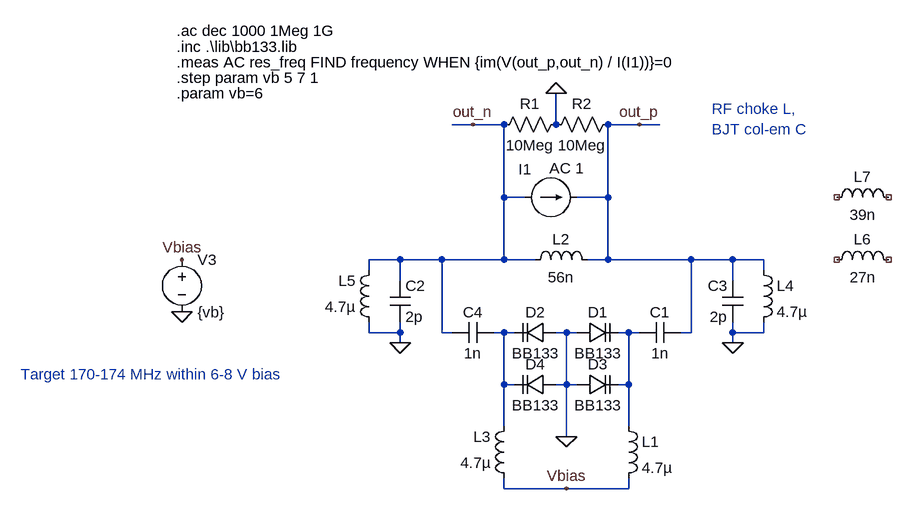
[diagram p0: schematic VHF_VCO_LO_tank.asc]
VHF_VCO_LO_tank.asc, the LTspice schematic file:
Version 4.1
SHEET 1 1056 1420
WIRE 224 736 192 736
WIRE 272 736 224 736
WIRE 352 736 352 688
WIRE 480 736 432 736
WIRE 512 736 480 736
WIRE 272 848 272 736
WIRE 304 848 272 848
WIRE 432 848 432 736
WIRE 432 848 384 848
WIRE 112 944 64 944
WIRE 176 944 112 944
WIRE 272 944 272 848
WIRE 272 944 176 944
WIRE 320 944 272 944
WIRE 432 944 432 848
WIRE 432 944 400 944
WIRE 560 944 432 944
WIRE 624 944 560 944
WIRE 672 944 624 944
WIRE 64 960 64 944
WIRE 672 960 672 944
WIRE 112 976 112 944
WIRE 624 976 624 944
WIRE 64 1056 64 1040
WIRE 112 1056 112 1040
WIRE 112 1056 64 1056
WIRE 176 1056 176 944
WIRE 192 1056 176 1056
WIRE 272 1056 256 1056
WIRE 288 1056 272 1056
WIRE 368 1056 352 1056
WIRE 384 1056 368 1056
WIRE 464 1056 448 1056
WIRE 480 1056 464 1056
WIRE 560 1056 560 944
WIRE 560 1056 544 1056
WIRE 624 1056 624 1040
WIRE 672 1056 672 1040
WIRE 672 1056 624 1056
WIRE 112 1072 112 1056
WIRE 624 1072 624 1056
WIRE 272 1136 272 1056
WIRE 288 1136 272 1136
WIRE 368 1136 368 1056
WIRE 368 1136 352 1136
WIRE 384 1136 368 1136
WIRE 464 1136 464 1056
WIRE 464 1136 448 1136
WIRE 272 1200 272 1136
WIRE 464 1200 464 1136
WIRE 368 1216 368 1136
WIRE 272 1296 272 1280
WIRE 368 1296 272 1296
WIRE 464 1296 464 1280
WIRE 464 1296 368 1296
FLAG -224 1024 0
FLAG -224 944 Vbias
FLAG 352 688 0
FLAG 480 736 out_p
FLAG 224 736 out_n
FLAG 368 1296 Vbias
FLAG 368 1216 0
FLAG 112 1072 0
FLAG 624 1072 0
SYMBOL varactor 384 1072 R270
WINDOW 0 32 32 VTop 2
WINDOW 3 0 32 VBottom 2
SYMATTR InstName D1
SYMATTR Value BB133
SYMATTR Prefix X
SYMBOL ind 304 960 R270
WINDOW 0 32 56 VTop 2
WINDOW 3 5 56 VBottom 2
SYMATTR InstName L2
SYMATTR Value 56n
SYMATTR SpiceLine Rser=3.9 Cpar=313f
SYMBOL varactor 352 1040 R90
WINDOW 0 0 32 VBottom 2
WINDOW 3 32 32 VTop 2
SYMATTR InstName D2
SYMATTR Value BB133
SYMATTR Prefix X
SYMBOL voltage -224 928 R0
WINDOW 123 0 0 Left 0
WINDOW 39 0 0 Left 0
WINDOW 3 24 97 Left 2
SYMATTR Value {vb}
SYMATTR InstName V3
SYMBOL current 304 848 R270
WINDOW 0 43 -10 VRight 2
WINDOW 3 24 0 Left 2
WINDOW 123 45 38 VRight 2
WINDOW 39 0 0 Left 0
SYMATTR InstName I1
SYMATTR Value ""
SYMATTR Value2 AC 1
SYMBOL res 368 720 R90
WINDOW 0 0 56 VBottom 2
WINDOW 3 32 56 VTop 2
SYMATTR InstName R1
SYMATTR Value 10Meg
SYMBOL res 448 720 R90
WINDOW 0 0 56 VBottom 2
WINDOW 3 32 56 VTop 2
SYMATTR InstName R2
SYMATTR Value 10Meg
SYMBOL cap 544 1040 R90
WINDOW 3 32 32 VTop 2
WINDOW 0 0 32 VBottom 2
SYMATTR Value 1n
SYMATTR InstName C1
SYMATTR SpiceLine Rser=20m Lser=281p
SYMBOL cap 96 976 R0
SYMATTR InstName C2
SYMATTR Value 2p
SYMBOL cap 640 1040 R180
WINDOW 0 24 56 Left 2
WINDOW 3 24 8 Left 2
SYMATTR InstName C3
SYMATTR Value 2p
SYMBOL ind 80 1056 R180
WINDOW 0 36 80 Left 2
WINDOW 3 36 40 Left 2
SYMATTR InstName L5
SYMATTR Value 4.7µ
SYMATTR SpiceLine Rser=345m Cpar=86.2f
SYMBOL ind 656 944 R0
SYMATTR InstName L4
SYMATTR Value 4.7µ
SYMATTR SpiceLine Rser=345m Cpar=86.2f
SYMBOL ind 448 1184 R0
SYMATTR InstName L1
SYMATTR Value 4.7µ
SYMATTR SpiceLine Rser=345m Cpar=86.2f
SYMBOL ind 288 1296 R180
WINDOW 0 36 80 Left 2
WINDOW 3 36 40 Left 2
SYMATTR InstName L3
SYMATTR Value 4.7µ
SYMATTR SpiceLine Rser=345m Cpar=86.2f
SYMBOL ind 768 960 R270
WINDOW 0 32 56 VTop 2
WINDOW 3 5 56 VBottom 2
SYMATTR InstName L6
SYMATTR Value 27n
SYMATTR SpiceLine Rser=2.3 Cpar=235f
SYMBOL ind 768 864 R270
WINDOW 0 32 56 VTop 2
WINDOW 3 5 56 VBottom 2
SYMATTR InstName L7
SYMATTR Value 39n
SYMATTR SpiceLine Rser=3 Cpar=287f
SYMBOL varactor 384 1152 R270
WINDOW 0 32 32 VTop 2
WINDOW 3 0 32 VBottom 2
SYMATTR InstName D3
SYMATTR Value BB133
SYMATTR Prefix X
SYMBOL varactor 352 1120 R90
WINDOW 0 0 32 VBottom 2
WINDOW 3 32 32 VTop 2
SYMATTR InstName D4
SYMATTR Value BB133
SYMATTR Prefix X
SYMBOL cap 256 1040 R90
WINDOW 3 32 32 VTop 2
WINDOW 0 0 32 VBottom 2
SYMATTR Value 1n
SYMATTR InstName C4
SYMATTR SpiceLine Rser=20m Lser=281p
TEXT -232 592 Left 2 !.ac dec 1000 1Meg 1G
TEXT -232 664 Left 2 !.step param vb 5 7 1
TEXT -472 1120 Left 2 ;Target 170-174 MHz within 6-8 V bias
TEXT -232 688 Left 2 !.param vb=6
TEXT -232 640 Left 2 !.meas AC res_freq FIND frequency WHEN {im(V(out_p,out_n) / I(I1))}=0
TEXT 592 712 Left 2 ;RF choke L,\nBJT col-em C
TEXT -232 616 Left 2 !.inc .\\lib\\bb133.lib

The netlist it stands for:
* VHF_VCO_LO_tank.asc
X§D1 0 N002 BB133  ; pins + -
L2 out_n out_p 56n Rser=3.9 Cpar=313f
X§D2 0 N001 BB133  ; pins + -
V3 Vbias 0 {vb}
I1 out_n out_p AC 1
R1 0 out_n 10Meg
R2 out_p 0 10Meg
C1 out_p N002 1n Rser=20m Lser=281p
C2 out_n 0 2p
C3 0 out_p 2p
L5 0 out_n 4.7µ Rser=345m Cpar=86.2f
L4 out_p 0 4.7µ Rser=345m Cpar=86.2f
L1 N002 Vbias 4.7µ Rser=345m Cpar=86.2f
L3 Vbias N001 4.7µ Rser=345m Cpar=86.2f
L6 NC_01 NC_02 27n Rser=2.3 Cpar=235f
L7 NC_03 NC_04 39n Rser=3 Cpar=287f
X§D3 0 N002 BB133  ; pins + -
X§D4 0 N001 BB133  ; pins + -
C4 N001 out_n 1n Rser=20m Lser=281p
.ac dec 1000 1Meg 1G
.step param vb 5 7 1
* Target 170-174 MHz within 6-8 V bias
.param vb=6
.meas AC res_freq FIND frequency WHEN {im(V(out_p,out_n) / I(I1))}=0
* RF choke L,
* BJT col-em C
.inc .\lib\bb133.lib
.backanno
.end